# Altium schematic sheet 1_P1.schdoc
size 307 x 218 mm; Symbol: Drawing-Symbol_A4; Device: Drawing-Symbol_A4; @Project Name: KeyConnect; @Page Count: 2; @Update Date: 2026-02-09; @Create Date: 2026-02-09; @Schematic Name: Schematic1_1; @Page No: 1; @Page Name: P1; Company: EasyEDA.com; Version: V1.0; Page Size: A4; @Create Time: 11:06:26; @Update Time: 20:12:03; Width: 1170; Height: 825; Region Start: 1; X Region Count: 6; Y Region Count: 4; Blade Width: 10; Title Block Position: 3; @Board Name: Board1_1
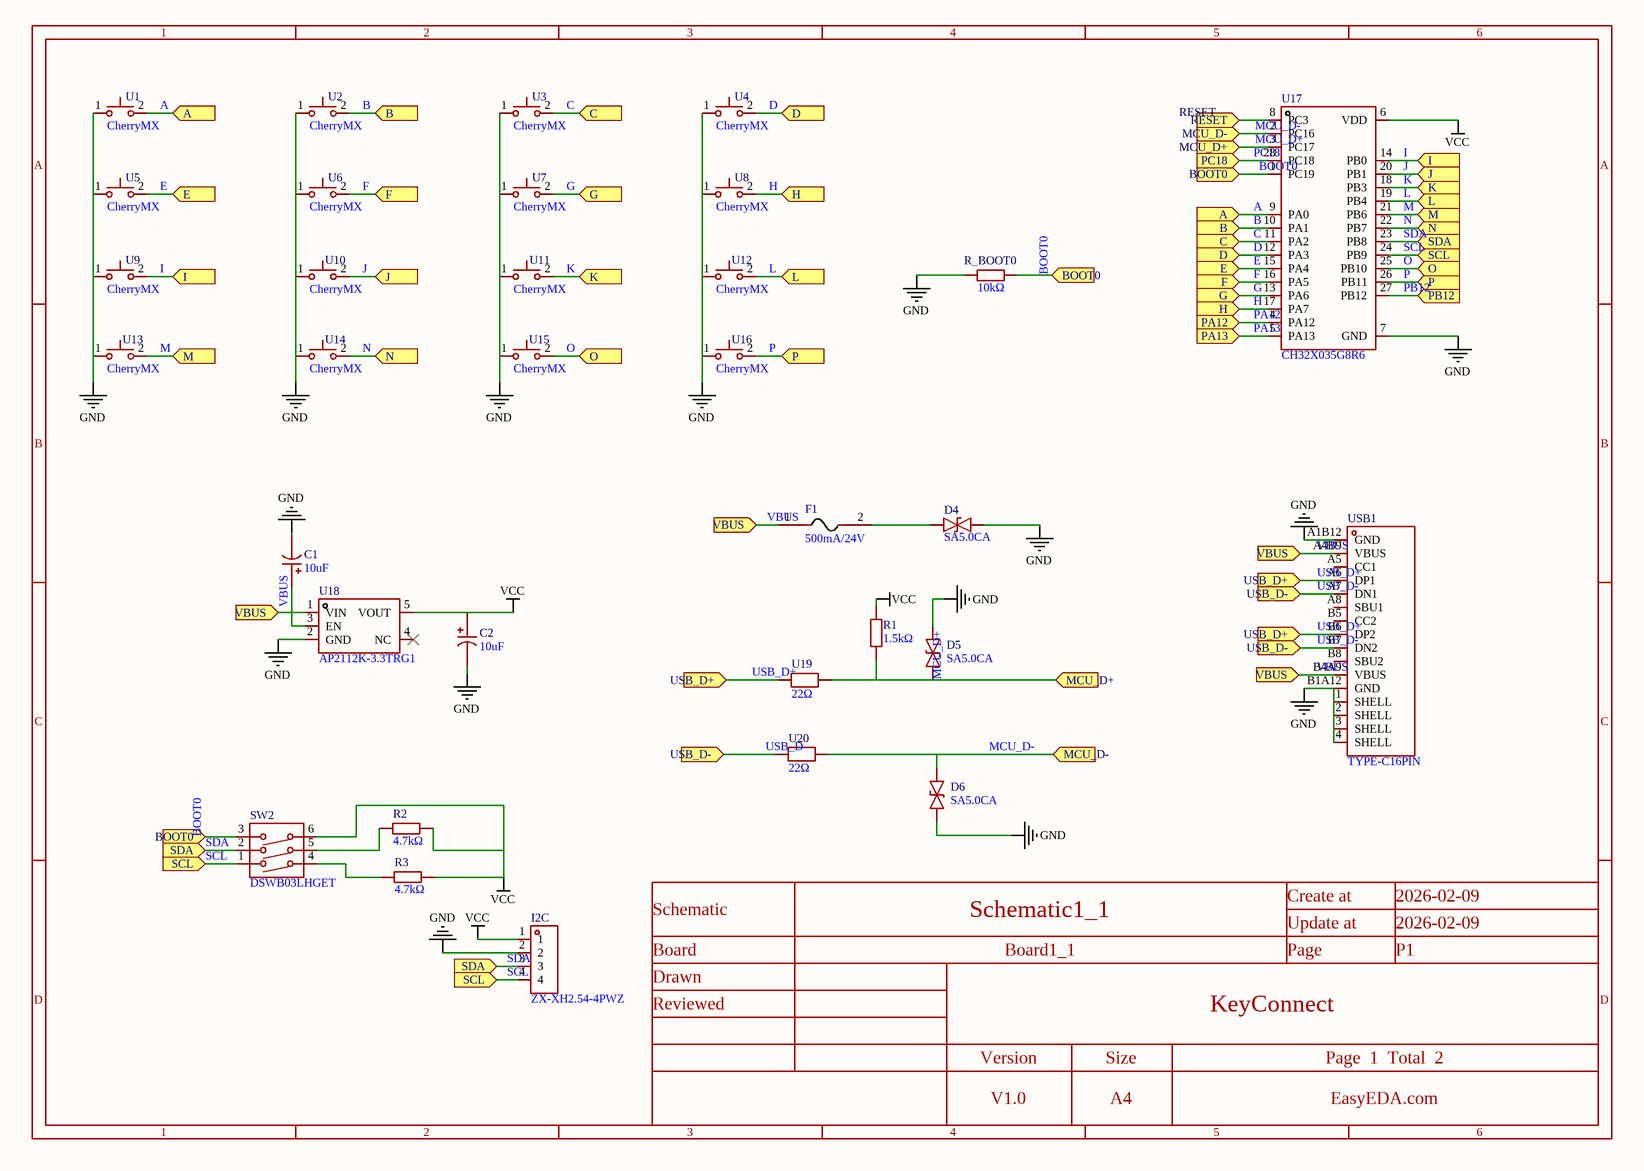
[diagram p0: 1_P1.schdoc]

## Parts
C1  10uF  [CAP-TH_BD5.5-P2.54-D0.5-FD]
C2  10uF  [CAP-TH_BD5.5-P2.54-D0.5-FD]
D4  SA5.0CA  [DO-15_BD3.1-L6.7-P10.70-D0.9-BI]
D5  SA5.0CA  [DO-15_BD3.1-L6.7-P10.70-D0.9-BI]
D6  SA5.0CA  [DO-15_BD3.1-L6.7-P10.70-D0.9-BI]
F1  500mA/24V  [F1206]
I2C  ZX-XH2.54-4PWZ  [CONN-TH_4P-P2.50_ZX-XH2.54-4PWZ]
R1  1.5kΩ  [RES-TH_BD2.3-L6.5-P10.50-D0.5]
R2  4.7kΩ  [RES-TH_BD2.3-L6.5-P10.50-D0.5]
R3  4.7kΩ  [RES-TH_BD2.3-L6.5-P10.50-D0.5]
R_BOOT0  10kΩ  [RES-TH_BD2.3-L6.5-P10.50-D0.5]
SW2  DSWB03LHGET  [SW-TH_DSWB03LHGET]
U1  CherryMX  [CherryMX_9.75u]
U2  CherryMX  [CherryMX_9.75u]
U3  CherryMX  [CherryMX_9.75u]
U4  CherryMX  [CherryMX_9.75u]
U5  CherryMX  [CherryMX_9.75u]
U6  CherryMX  [CherryMX_9.75u]
U7  CherryMX  [CherryMX_9.75u]
U8  CherryMX  [CherryMX_9.75u]
U9  CherryMX  [CherryMX_9.75u]
U10  CherryMX  [CherryMX_9.75u]
U11  CherryMX  [CherryMX_9.75u]
U12  CherryMX  [CherryMX_9.75u]
U13  CherryMX  [CherryMX_9.75u]
U14  CherryMX  [CherryMX_9.75u]
U15  CherryMX  [CherryMX_9.75u]
U16  CherryMX  [CherryMX_9.75u]
U17  CH32X035G8R6  [QSOP-28_L9.9-W3.9-P0.64-LS6.0-BL]
U18  AP2112K-3.3TRG1  [SOT-23-5_L2.9-W1.6-P0.95-LS2.8-BR]
U19  22Ω  [RES-TH_BD2.3-L3.7-P7.70-D0.4]
U20  22Ω  [RES-TH_BD2.3-L3.7-P7.70-D0.4]
USB1  TYPE-C16PIN  [USB-C-SMD_TYPE-C16PIN]

## Ports
A (in), B (in), BOOT0 (in), C (in), D (in), E (in), F (in), G (in), H (in), I (in), J (in), K (in), L (in), M (in), MCU_D+ (in), MCU_D- (in), N (in), O (in), P (in), PA12 (in), PA13 (in), PB12 (in), PC18 (in), RESET (in), SCL (in), SDA (in), USB_D+ (in), USB_D- (in), VBUS (in)

## Nets
GND: C1.1 C2.1 D4.2 D5.1 D6.1 I2C.2 R_BOOT0.1 U1.1 U2.1 U3.1 U4.1 U5.1 U6.1 U7.1 U8.1 U9.1 U10.1 U11.1 U12.1 U13.1 U14.1 U15.1 U16.1 U17.7(GND) U18.2(GND) USB1.1(SHELL) USB1.2(SHELL) USB1.3(SHELL) USB1.4(SHELL) USB1.A1B12(GND) USB1.B1A12(GND)
VCC: C2.2 I2C.1 R1.2 R2.2 R3.2 SW2.6 U17.6(VDD) U18.5(VOUT)
A: U1.2 U17.9(PA0) ; port A
B: U2.2 U17.10(PA1) ; port B
BOOT0: R_BOOT0.2 SW2.3 U17.1(PC19) ; port BOOT0
C: U3.2 U17.11(PA2) ; port C
D: U4.2 U17.12(PA3) ; port D
E: U5.2 U17.15(PA4) ; port E
F: U6.2 U17.16(PA5) ; port F
G: U7.2 U17.13(PA6) ; port G
H: U8.2 U17.17(PA7) ; port H
I: U9.2 U17.14(PB0) ; port I
J: U10.2 U17.20(PB1) ; port J
K: U11.2 U17.18(PB3) ; port K
L: U12.2 U17.19(PB4) ; port L
M: U13.2 U17.21(PB6) ; port M
MCU_D+: D5.2 R1.1 U17.3(PC17) U19.2 ; port MCU_D+
MCU_D-: D6.2 U17.2(PC16) U20.2 ; port MCU_D-
N: U14.2 U17.22(PB7) ; port N
O: U15.2 U17.25(PB10) ; port O
P: U16.2 U17.26(PB11) ; port P
PA12: U17.4(PA12) ; port PA12
PA13: U17.5(PA13) ; port PA13
PB12: U17.27(PB12) ; port PB12
PC18: U17.28(PC18) ; port PC18
RESET: U17.8(PC3) ; port RESET
SCL: I2C.4 SW2.1 U17.24(PB9) ; port SCL
SDA: I2C.3 SW2.2 U17.23(PB8) ; port SDA
USB_D+: U19.1 USB1.A6(DP1) USB1.B6(DP2) ; port USB_D+
USB_D-: U20.1 USB1.A7(DN1) USB1.B7(DN2) ; port USB_D-
VBUS: C1.2 F1.1 U18.1(VIN) U18.3(EN) USB1.A4B9(VBUS) USB1.B4A9(VBUS) ; port VBUS
NetD4_1: D4.1 F1.2
NetR2_1: R2.1 SW2.5
NetR3_1: R3.1 SW2.4

Not connected (* = marked no-connect by the designer): U18 4(NC)*; USB1 A5(CC1) A8(SBU1) B5(CC2) B8(SBU2)

## Notes on the sheet
- Labels drawn without touching a wire or pin: RESET
- 1
- 2
- 3
- 4
- 5
- 6
- A
- B
- C
- Schematic
- Schematic1_1
- Create at
- Update at
- 2026-02-09
- Board
- Drawn
- Board1_1
- Page
- P1
- D
- Reviewed
- Version
- Size
- KeyConnect
- Page  1  Total  2
- V1.0
- A4
- EasyEDA.com

## Library data of the parts
C1 C2 = 199D106X0025C1V1E3: Manufacturer: VISHAY(威世); Add into BOM: yes; Tolerance: ±20%; Voltage Rating: 25V; Current - Leakage: 2.5uA; Symbol: 199D106X0025C1V1E3; Device: 199D106X0025C1V1E3; LCSC Part Name: 10uF ±20% 25V; Supplier Part: C1651807; Manufacturer Part: 199D106X0025C1V1E3; Supplier Footprint: 插件; JLCPCB Part Class: Extended Part; Datasheet: https://item.szlcsc.com/datasheet/199D106X0025C1V1E3/1742655.html; Supplier: LCSC; Convert to PCB: yes; Value: 10uF; Ripple Current: -; Equivalent Series Resistance(ESR): -; Operating Temperature: -55℃~+125℃
D4-D6 = SA5.0CA_C5310909: Manufacturer: SUNMATE(森美特); Add into BOM: yes; Polarity: Bidirectional; Reverse Stand-Off Voltage (Vrwm): 5V; Clamping Voltage: 9.2V; Peak Pulse Current (Ipp): 55.4A@10/1000us; Peak Pulse Power Dissipation (Ppp): 500W@10/1000us; Voltage - Breakdown: 7.25V; Reverse Leakage Current (Ir): 600uA; Type: TVS; Symbol: SA5.0CA_C5310909; Device: SA5.0CA_C5310909; LCSC Part Name: 双向TVS 5V截止 峰值脉冲电流：55.4A@10/1000us; Supplier Part: C5310909; Manufacturer Part: SA5.0CA; Supplier Footprint: DO-15; JLCPCB Part Class: Extended Part; Datasheet: https://item.szlcsc.com/datasheet/SA5.0CA/6066722.html; Supplier: LCSC; Convert to PCB: yes; Operating Temperature: -65℃~+175℃
F1 = 500mA/24V: Manufacturer: DOWO(东沃); Add into BOM: yes; Voltage - Max: 24V; Current - Max: 40A; Hold Current: 500mA; Trip Current: 1A; Power Dissipation: 600mW; Resistance - Initial (Ri) (Min): 150mΩ; Resistance - Post Trip (R1) (Max): 700mΩ; Time to Trip(Max): 8s; Symbol: 500MA/24V; Device: 500mA/24V; LCSC Part Name: 24V 0.5A 1206自恢复; Supplier Part: C2984676; Manufacturer Part: 500mA/24V; Supplier Footprint: 1206; JLCPCB Part Class: Extended Part; Datasheet: https://item.szlcsc.com/datasheet/500mA%252F24V/3426281.html; Supplier: LCSC; Convert to PCB: yes; Operating Temperature: -40℃~+85℃; Length: -; Width: -; Height: -; Pitch: -
I2C = ZX-XH2.54-4PWZ: Manufacturer: Megastar(兆星); Add into BOM: yes; Pins Structure: 1x4P; Pitch: 2.5mm; Reference Series: XH; Number of PINs Per Row: 4; Current Rating: 3A; Voltage Rating: 250V; Plastic Material: PA66; Flame Retardant Rating: UL94V-0; Z-Height of the Board: 5.9mm; X-Length of Bottom Edge on Board (Spacing Line): 12.5mm; Y-Width of Bottom Edge on Board: 7.32mm; Symbol: ZX-XH2.54-4PWZ; Device: ZX-XH2.54-4PWZ; LCSC Part Name: 1x4P 间距:2.5mm 弯插 系列:XH; Supplier Part: C7429643; Manufacturer Part: ZX-XH2.54-4PWZ; Supplier Footprint: 弯插,P=2.5mm; JLCPCB Part Class: Extended Part; Datasheet: https://item.szlcsc.com/datasheet/ZX-XH2.54-4PWZ/8427560.html; Supplier: LCSC; Convert to PCB: yes; Mounting Type: Right Angle; Number of Pins: 4P; Number of Rows: 1; Row Spacing: -; Contact Material: Brass; Contact Plating: Tin; Operating Temperature: -25℃~+85℃; Supplementary Features: -; Color: White
R1 = MF1/4W-1.5KΩ±1% T: Manufacturer: CCO(千志电子); Symbol: MF1/4W-1.5KΩ±1% T52; Add into BOM: yes; Tolerance: ±1%; Voltage-Supply(Max): 250V; Power(Watts): 250mW; Temperature Coefficient: ±100ppm/℃; Device: MF1/4W-1.5KΩ±1% T; LCSC Part Name: 1.5kΩ ±1% 250mW 金属膜电阻; Supplier Part: C119328; Manufacturer Part: MF1/4W-1.5KΩ±1% T; Supplier Footprint: 插件,D2.3xL6.5mm; JLCPCB Part Class: Extended Part; Datasheet: https://atta.szlcsc.com/upload/public/pdf/source/20190910/C427326_62A6D058BC0FF74963A2F22379CA06CE.pdf; Supplier: LCSC; Convert to PCB: yes; Type: Metal Film Resistors; Value: 1.5kΩ; Operating Temperature: -55℃~+155℃
R2 R3 = MF1/4W-4.7KΩ±1% T: Manufacturer: CCO(千志电子); Symbol: MF1/4W-4.7KΩ±1% T52; Add into BOM: yes; Tolerance: ±1%; Voltage-Supply(Max): 250V; Power(Watts): 250mW; Temperature Coefficient: ±100ppm/℃; Device: MF1/4W-4.7KΩ±1% T; LCSC Part Name: 4.7kΩ ±1% 250mW 金属膜电阻 圆柱状直插; Supplier Part: C119339; Manufacturer Part: MF1/4W-4.7KΩ±1% T; Supplier Footprint: 插件,D2.3xL6.5mm; JLCPCB Part Class: Extended Part; Datasheet: https://item.szlcsc.com/datasheet/MF1%252F4W-4.7K%25CE%25A9%25C2%25B11%2525%2520T/120608.html; Supplier: LCSC; Convert to PCB: yes; Type: Metal Film Resistor; Value: 4.7kΩ; Operating Temperature: -55℃~+155℃
R_BOOT0 = MF1/4W-10KΩ±1% T: Manufacturer: CCO(千志电子); Symbol: MF1/4W-10KΩ±1% T52; Add into BOM: yes; Tolerance: ±1%; Voltage-Supply(Max): 250V; Power(Watts): 250mW; Temperature Coefficient: ±100ppm/℃; Device: MF1/4W-10KΩ±1% T; LCSC Part Name: 10kΩ ±1% 250mW 金属膜电阻 圆柱状直插; Supplier Part: C119347; Manufacturer Part: MF1/4W-10KΩ±1% T; Supplier Footprint: 插件,D2.3xL6.5mm; JLCPCB Part Class: Extended Part; Datasheet: https://atta.szlcsc.com/upload/public/pdf/source/20190910/C427326_62A6D058BC0FF74963A2F22379CA06CE.pdf; Supplier: LCSC; Convert to PCB: yes; Type: Metal Film Resistors; Value: 10kΩ; Operating Temperature: -55℃~+155℃
SW2 = DSWB03LHGET: Manufacturer: YE; Add into BOM: yes; Circuit: SPST; Number of Positions: 3; Symbol: DSWB03LHGET; Device: DSWB03LHGET; LCSC Part Name: 间距2.54mm 平拨,凸起式 3位拨码开关; Supplier Part: C99420; Manufacturer Part: DSWB03LHGET; Supplier Footprint: 插件; JLCPCB Part Class: Extended Part; Datasheet: https://item.szlcsc.com/datasheet/DSWB03LHGET/100634.html; Supplier: LCSC; Convert to PCB: yes; Type: Slide, Rocked; Lead Pitch: 2.54mm; Operating Life: -; Color: Red
U1-U16 = CherryMX: Add into BOM: yes; Symbol: CherryMX; Device: CherryMX; Convert to PCB: yes
U17 = CH32X035G8R6_C49118551: Manufacturer: WCH(南京沁恒); Add into BOM: yes; Symbol: CH32X035G8R6_C49118551; Device: CH32X035G8R6_C49118551; LCSC Part Name: 基于青稞RISC-V内核的工业级微控制器; Supplier Part: C49118551; Manufacturer Part: CH32X035G8R6; Supplier Footprint: QSOP28; JLCPCB Part Class: Extended Part; Datasheet: https://item.szlcsc.com/datasheet/CH32X035G8R6/51503242.html; Supplier: LCSC; Convert to PCB: yes
U18 = AP2112K-3.3TRG1_C23380830: Manufacturer: TECH PUBLIC(台舟); Add into BOM: yes; Output Type: Fixed; Voltage - Supply: 5.5V; Output Voltage: 3.3V; Output Current: 600mA; Power Supply Rejection Ratio (PSRR): 75dB@(1kHz); Voltage Dropout: 320mV@(600mA); standby current: 10uA; Output Configuration: Positive; Number of Outputs: 1; Symbol: AP2112K-3.3TRG1_C23380830; Device: AP2112K-3.3TRG1_C23380830; LCSC Part Name: 3.3V 600mA 5.5V; Supplier Part: C23380830; Manufacturer Part: AP2112K-3.3TRG1; Supplier Footprint: SOT-23-5; JLCPCB Part Class: Extended Part; Datasheet: https://item.szlcsc.com/datasheet/AP2112K-3.3TRG1/25111500.html; Supplier: LCSC; Convert to PCB: yes; Features: Over Temperature Protection; Operating Temperature: -40℃~+85℃@(Ta)
U19 U20 = CR1/8W-22Ω±5%-ST52: Manufacturer: VO(翔胜); Add into BOM: yes; Tolerance: ±5%; Voltage-Supply(Max): 200V; Power(Watts): 125mW; Temperature Coefficient: ±350ppm/℃; Symbol: CR1/8W-22Ω±5%-ST52; Device: CR1/8W-22Ω±5%-ST52; LCSC Part Name: 碳膜电阻 22Ω ±5% 125mW; Supplier Part: C2896979; Manufacturer Part: CR1/8W-22Ω±5%-ST52; Supplier Footprint: 插件,D2.3xL3.7mm; JLCPCB Part Class: Extended Part; Datasheet: https://item.szlcsc.com/datasheet/CR1%252F8W-22%25CE%25A9%25C2%25B15%2525-ST52/3140235.html; Supplier: LCSC; Convert to PCB: yes; Type: Carbon Film Resistor; Value: 22Ω; Operating Temperature: -55℃~+155℃
USB1 = TYPE-C16PIN: Manufacturer: SHOU HAN(首韩); Add into BOM: yes; Connector Type: Type-C; Gender: Female; Number of Contacts: 16P; Number of Ports: 1; Current Rating-Power: 3A; Voltage Rating: 30V; Connect-Disconnect Life: 10,000 Cycles; Detection color: Black; Symbol: TYPE-C16PIN; Device: TYPE-C16PIN; LCSC Part Name: 16P卧贴母座; Supplier Part: C393939; Manufacturer Part: TYPE-C16PIN; Supplier Footprint: SMD; JLCPCB Part Class: Extended Part; Datasheet: https://item.szlcsc.com/datasheet/TYPE-C16PIN/372551.html; Supplier: LCSC; Convert to PCB: yes; Protocol Standard: -; Mounting Type: Surface Mount, Right Angle; Supplementary Features: -; Center Height: -; Length: -; Operating Temperature: -40℃~+85℃